# Altium schematic sheet display_mode.SchDoc
size 254 x 203 mm
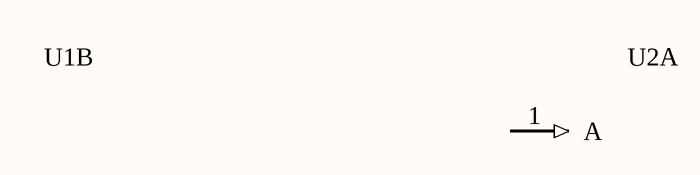
[diagram p0: display_mode.SchDoc]

## Parts
U1  (no value)  (part B of 2)
U2  (no value)  (part A of 2)

## Nets

Not connected (* = marked no-connect by the designer): U2 1(A)

## Library data of the parts
U1 U2 = Dual